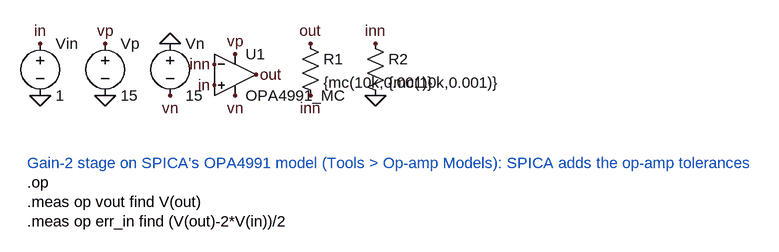
[diagram p0: schematic opamp_gain2.asc]
opamp_gain2.asc, the LTspice schematic file:
Version 4
SHEET 1 880 680
SYMBOL OpAmps\opamp2 400 100 R0
SYMATTR InstName U1
SYMATTR Value OPA4991_MC
SYMBOL res 500 100 R0
SYMATTR InstName R1
SYMATTR Value {mc(10k,0.001)}
SYMBOL res 600 100 R0
SYMATTR InstName R2
SYMATTR Value {mc(10k,0.001)}
SYMBOL voltage 100 100 R0
SYMATTR InstName Vin
SYMATTR Value 1
SYMBOL voltage 200 100 R0
SYMATTR InstName Vp
SYMATTR Value 15
SYMBOL voltage 300 100 R0
SYMATTR InstName Vn
SYMATTR Value 15
FLAG 368 180 in
FLAG 368 148 inn
FLAG 400 132 vp
FLAG 400 196 vn
FLAG 432 164 out
FLAG 516 116 out
FLAG 516 196 inn
FLAG 616 116 inn
FLAG 616 196 0
FLAG 100 116 in
FLAG 100 196 0
FLAG 200 116 vp
FLAG 200 196 0
FLAG 300 116 0
FLAG 300 196 vn
TEXT 80 300 Left 2 ;Gain-2 stage on SPICA's OPA4991 model (Tools > Op-amp Models): SPICA adds the op-amp tolerances
TEXT 80 330 Left 2 !.op
TEXT 80 360 Left 2 !.meas op vout find V(out)
TEXT 80 390 Left 2 !.meas op err_in find (V(out)-2*V(in))/2

The netlist it stands for:
* opamp_gain2.asc
XU1 in inn vp vn out OPA4991_MC  ; pins In+ In- V+ V- OUT
R1 out inn {mc(10k,0.001)}
R2 inn 0 {mc(10k,0.001)}
Vin in 0 1
Vp vp 0 15
Vn 0 vn 15
* Gain-2 stage on SPICA's OPA4991 model (Tools > Op-amp Models): SPICA adds the op-amp tolerances
.op
.meas op vout find V(out)
.meas op err_in find (V(out)-2*V(in))/2
.backanno
.end